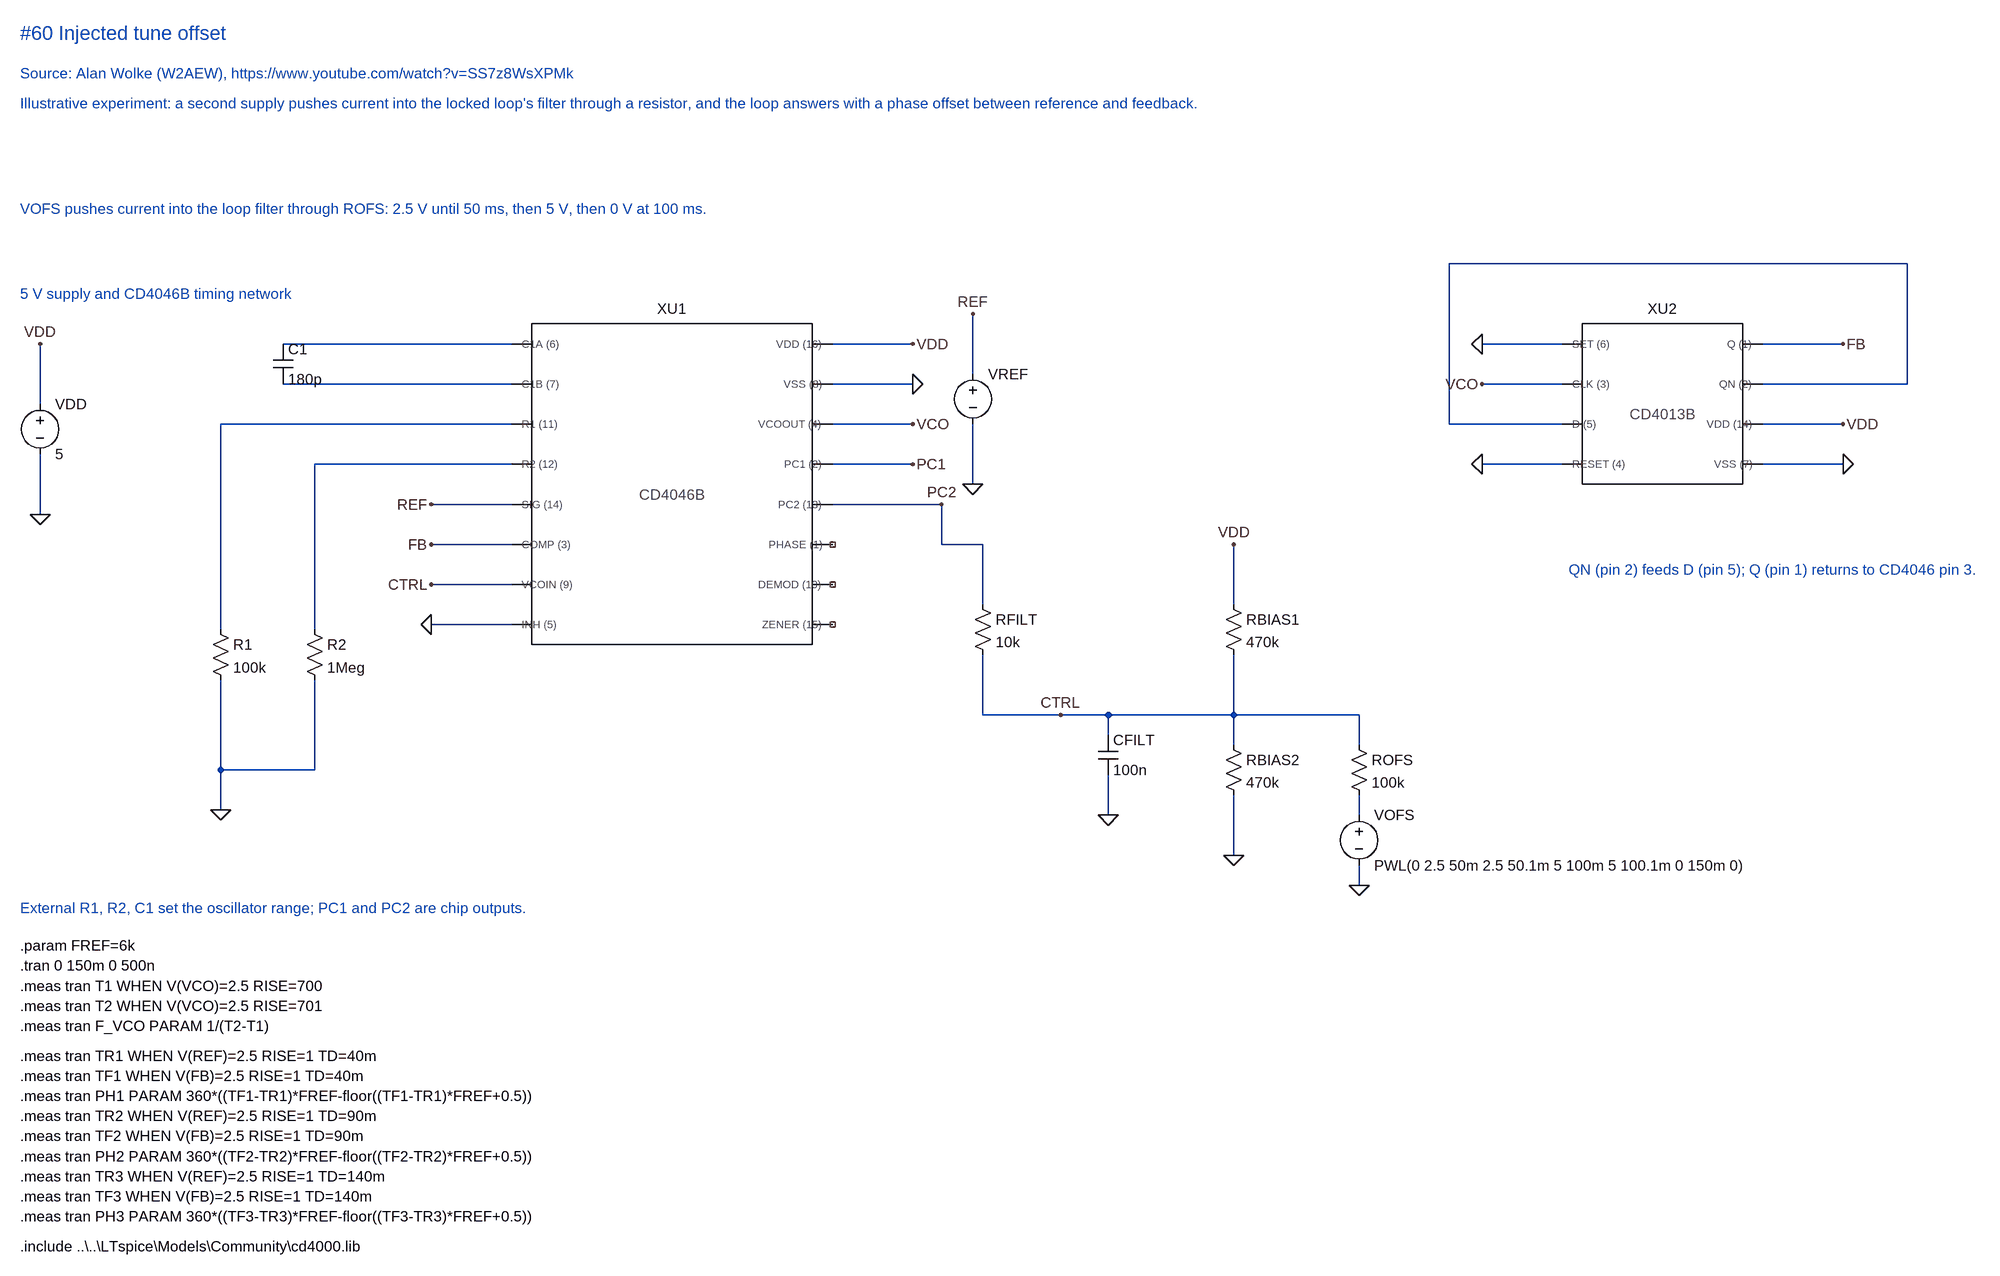
[diagram p0: schematic Injected tune offset.asc]
Injected tune offset.asc, the LTspice schematic file:
Version 4.1
SHEET 1 3500 1900
WIRE 112 160 112 256
WIRE 112 432 112 336
WIRE 864 160 500 160
WIRE 864 224 500 224
WIRE 864 288 400 288
WIRE 400 616 400 288
WIRE 864 352 550 352
WIRE 550 616 550 352
WIRE 400 840 400 696
WIRE 550 840 550 696
WIRE 550 840 400 840
WIRE 400 904 400 840
WIRE 736 416 864 416
WIRE 736 480 864 480
WIRE 736 544 864 544
WIRE 736 608 864 608
WIRE 1504 160 1376 160
WIRE 1504 224 1376 224
WIRE 1504 288 1376 288
WIRE 1504 352 1376 352
WIRE 1504 416 1376 416
WIRE 1600 112 1600 208
WIRE 1600 384 1600 288
WIRE 2412 160 2540 160
WIRE 2412 224 2540 224
WIRE 2412 352 2540 352
WIRE 2988 160 2860 160
WIRE 2988 288 2860 288
WIRE 2988 352 2860 352
WIRE 3090 224 2860 224
WIRE 3090 32 3090 224
WIRE 2360 32 3090 32
WIRE 2360 288 2360 32
WIRE 2540 288 2360 288
WIRE 1550 416 1504 416
WIRE 1550 480 1550 416
WIRE 1616 480 1550 480
WIRE 1616 576 1616 480
WIRE 1616 752 1616 656
WIRE 1740 752 1616 752
WIRE 1816 752 1740 752
WIRE 1816 784 1816 752
WIRE 1816 912 1816 848
WIRE 2016 480 2016 576
WIRE 2016 752 2016 656
WIRE 2016 752 1816 752
WIRE 2016 800 2016 752
WIRE 2016 976 2016 880
WIRE 2216 752 2016 752
WIRE 2216 800 2216 752
WIRE 2216 912 2216 880
WIRE 2216 1024 2216 992
FLAG 112 160 VDD
FLAG 112 432 0
FLAG 400 904 0
FLAG 736 416 REF
FLAG 736 480 FB
FLAG 736 544 CTRL
FLAG 736 608 0
FLAG 1504 160 VDD
FLAG 1504 224 0
FLAG 1504 288 VCO
FLAG 1504 352 PC1
FLAG 1600 112 REF
FLAG 1600 384 0
FLAG 1816 912 0
FLAG 2016 480 VDD
FLAG 2016 976 0
FLAG 1550 416 PC2
FLAG 1740 752 CTRL
FLAG 2216 1024 0
FLAG 2412 160 0
FLAG 2412 224 VCO
FLAG 2412 352 0
FLAG 2988 160 FB
FLAG 2988 288 VDD
FLAG 2988 352 0
SYMBOL voltage 112 240 R0
SYMATTR InstName VDD
SYMATTR Value 5
SYMBOL cap 484 160 R0
SYMATTR InstName C1
SYMATTR Value 180p
SYMBOL res 384 600 R0
SYMATTR InstName R1
SYMATTR Value 100k
SYMBOL res 534 600 R0
SYMATTR InstName R2
SYMATTR Value 1Meg
SYMBOL ..\..\LTspice\Symbols\CD4046_board 1120 160 R0
SYMATTR InstName XU1
SYMATTR Value CD4046Bg
SYMBOL voltage 1600 192 R0
WINDOW 3 24 96 Invisible 2
SYMATTR InstName VREF
SYMATTR Value PULSE(0 5 0 20n 20n {0.5/FREF} {1/FREF})
SYMBOL res 1600 560 R0
SYMATTR InstName RFILT
SYMATTR Value 10k
SYMBOL cap 1800 784 R0
SYMATTR InstName CFILT
SYMATTR Value 100n
SYMBOL res 2000 560 R0
SYMATTR InstName RBIAS1
SYMATTR Value 470k
SYMBOL res 2000 784 R0
SYMATTR InstName RBIAS2
SYMATTR Value 470k
SYMBOL res 2200 784 R0
SYMATTR InstName ROFS
SYMATTR Value 100k
SYMBOL voltage 2216 896 R0
SYMATTR InstName VOFS
SYMATTR Value PWL(0 2.5 50m 2.5 50.1m 5 100m 5 100.1m 0 150m 0)
SYMBOL ..\..\LTspice\Symbols\CD4013_board 2700 160 R0
SYMATTR InstName XU2
SYMATTR Value CD4013B
SYMATTR SpiceLine VDD=5 SPEED=1 TRIPDT=5n
TEXT 80 -56 Left 2 ;VOFS pushes current into the loop filter through ROFS: 2.5 V until 50 ms, then 5 V, then 0 V at 100 ms.
TEXT 80 80 Left 2 ;5 V supply and CD4046B timing network
TEXT 80 1060 Left 2 ;External R1, R2, C1 set the oscillator range; PC1 and PC2 are chip outputs.
TEXT 2550 520 Left 2 ;QN (pin 2) feeds D (pin 5); Q (pin 1) returns to CD4046 pin 3.
TEXT 80 1120 Left 2 !.param FREF=6k
TEXT 80 1152 Left 2 !.tran 0 150m 0 500n
TEXT 80 1184 Left 2 !.meas tran T1 WHEN V(VCO)=2.5 RISE=700
TEXT 80 1216 Left 2 !.meas tran T2 WHEN V(VCO)=2.5 RISE=701
TEXT 80 1248 Left 2 !.meas tran F_VCO PARAM 1/(T2-T1)
TEXT 80 1296 Left 2 !.meas tran TR1 WHEN V(REF)=2.5 RISE=1 TD=40m
TEXT 80 1328 Left 2 !.meas tran TF1 WHEN V(FB)=2.5 RISE=1 TD=40m
TEXT 80 1360 Left 2 !.meas tran PH1 PARAM 360*((TF1-TR1)*FREF-floor((TF1-TR1)*FREF+0.5))
TEXT 80 1392 Left 2 !.meas tran TR2 WHEN V(REF)=2.5 RISE=1 TD=90m
TEXT 80 1424 Left 2 !.meas tran TF2 WHEN V(FB)=2.5 RISE=1 TD=90m
TEXT 80 1456 Left 2 !.meas tran PH2 PARAM 360*((TF2-TR2)*FREF-floor((TF2-TR2)*FREF+0.5))
TEXT 80 1488 Left 2 !.meas tran TR3 WHEN V(REF)=2.5 RISE=1 TD=140m
TEXT 80 1520 Left 2 !.meas tran TF3 WHEN V(FB)=2.5 RISE=1 TD=140m
TEXT 80 1552 Left 2 !.meas tran PH3 PARAM 360*((TF3-TR3)*FREF-floor((TF3-TR3)*FREF+0.5))
TEXT 80 1600 Left 2 !.include ..\..\LTspice\Models\Community\cd4000.lib
TEXT 80 -336 Left 3 ;#60 Injected tune offset
TEXT 80 -272 Left 2 ;Source: Alan Wolke (W2AEW), https://www.youtube.com/watch?v=SS7z8WsXPMk
TEXT 80 -224 Left 2 ;Illustrative experiment: a second supply pushes current into the locked loop's filter through a resistor, and the loop answers with a phase offset between reference and feedback.

The netlist it stands for:
* Injected tune offset.asc
VDD VDD 0 5
C1 N001 N002 180p
R1 N003 0 100k
R2 N004 0 1Meg
X§XU1 N001 N002 FB 0 N003 N004 REF CTRL VDD 0 NC_01 PC1 PC2 NC_02 VCO NC_03 CD4046Bg  ; pins C1A_(6) C1B_(7) COMP_(3) INH_(5) R1_(11) R2_(12) SIG_(14) VCOIN_(9) VDD_(16) VSS_(8) DEMOD_(10) PC1_(2) PC2_(13) PHASE_(1) VCOOUT_(4) ZENER_(15)
VREF REF 0 PULSE(0 5 0 20n 20n {0.5/FREF} {1/FREF})
RFILT PC2 CTRL 10k
CFILT CTRL 0 100n
RBIAS1 VDD CTRL 470k
RBIAS2 CTRL 0 470k
ROFS CTRL N006 100k
VOFS N006 0 PWL(0 2.5 50m 2.5 50.1m 5 100m 5 100.1m 0 150m 0)
X§XU2 0 VCO N005 0 FB N005 VDD 0 CD4013B VDD=5 SPEED=1 TRIPDT=5n  ; pins SET_(6) CLK_(3) D_(5) RESET_(4) Q_(1) QN_(2) VDD_(14) VSS_(7)
* VOFS pushes current into the loop filter through ROFS: 2.5 V until 50 ms, then 5 V, then 0 V at 100 ms.
* 5 V supply and CD4046B timing network
* External R1, R2, C1 set the oscillator range; PC1 and PC2 are chip outputs.
* QN (pin 2) feeds D (pin 5); Q (pin 1) returns to CD4046 pin 3.
.param FREF=6k
.tran 0 150m 0 500n
.meas tran T1 WHEN V(VCO)=2.5 RISE=700
.meas tran T2 WHEN V(VCO)=2.5 RISE=701
.meas tran F_VCO PARAM 1/(T2-T1)
.meas tran TR1 WHEN V(REF)=2.5 RISE=1 TD=40m
.meas tran TF1 WHEN V(FB)=2.5 RISE=1 TD=40m
.meas tran PH1 PARAM 360*((TF1-TR1)*FREF-floor((TF1-TR1)*FREF+0.5))
.meas tran TR2 WHEN V(REF)=2.5 RISE=1 TD=90m
.meas tran TF2 WHEN V(FB)=2.5 RISE=1 TD=90m
.meas tran PH2 PARAM 360*((TF2-TR2)*FREF-floor((TF2-TR2)*FREF+0.5))
.meas tran TR3 WHEN V(REF)=2.5 RISE=1 TD=140m
.meas tran TF3 WHEN V(FB)=2.5 RISE=1 TD=140m
.meas tran PH3 PARAM 360*((TF3-TR3)*FREF-floor((TF3-TR3)*FREF+0.5))
.include ..\..\LTspice\Models\Community\cd4000.lib
* #60 Injected tune offset
* Source: Alan Wolke (W2AEW), https://www.youtube.com/watch?v=SS7z8WsXPMk
* Illustrative experiment: a second supply pushes current into the locked loop's filter through a resistor, and the loop answers with a phase offset between reference and feedback.
.lib ..\..\LTspice\Models\Community\CD4046Bg-corrected.sub
.backanno
.end